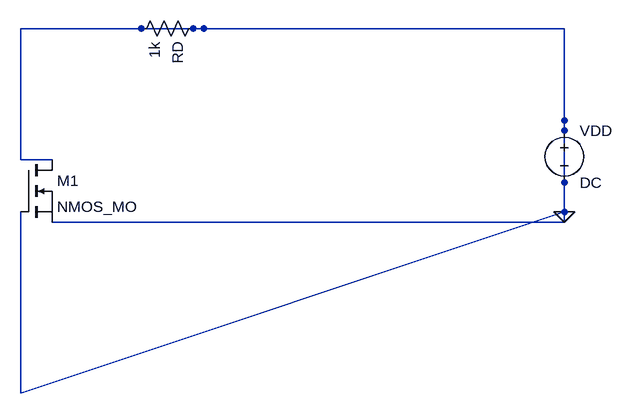
[diagram p0: schematic netlist.asc]
netlist.asc, the LTspice schematic file:
Version 4
SHEET 1 680 480
SYMBOL voltage 1095 399 R0
SYMATTR InstName VDD
SYMATTR Value DC
FLAG 1095 540 0
SYMBOL res 540 242 R90
SYMATTR InstName RD
SYMATTR Value 1k
SYMBOL nmos 258 460 R0
SYMATTR InstName M1
SYMATTR Value NMOS_MO
WIRE 1095 540 1095 399
WIRE 524 258 819 258
WIRE 258 258 540 258
WIRE 258 819 1095 540
WIRE 1095 258 1095 415
WIRE 1095 258 819 258
WIRE 306 460 258 460
WIRE 258 460 258 258
WIRE 258 540 258 819
WIRE 306 556 1095 556
WIRE 1095 556 1095 540

The netlist it stands for:
* netlist.asc
VDD 0 0 DC
RD 0 0 1k
M1 0 0 0 0 NMOS_MO
.model NMOS NMOS
.model PMOS PMOS
.lib standard.mos
.backanno
.end